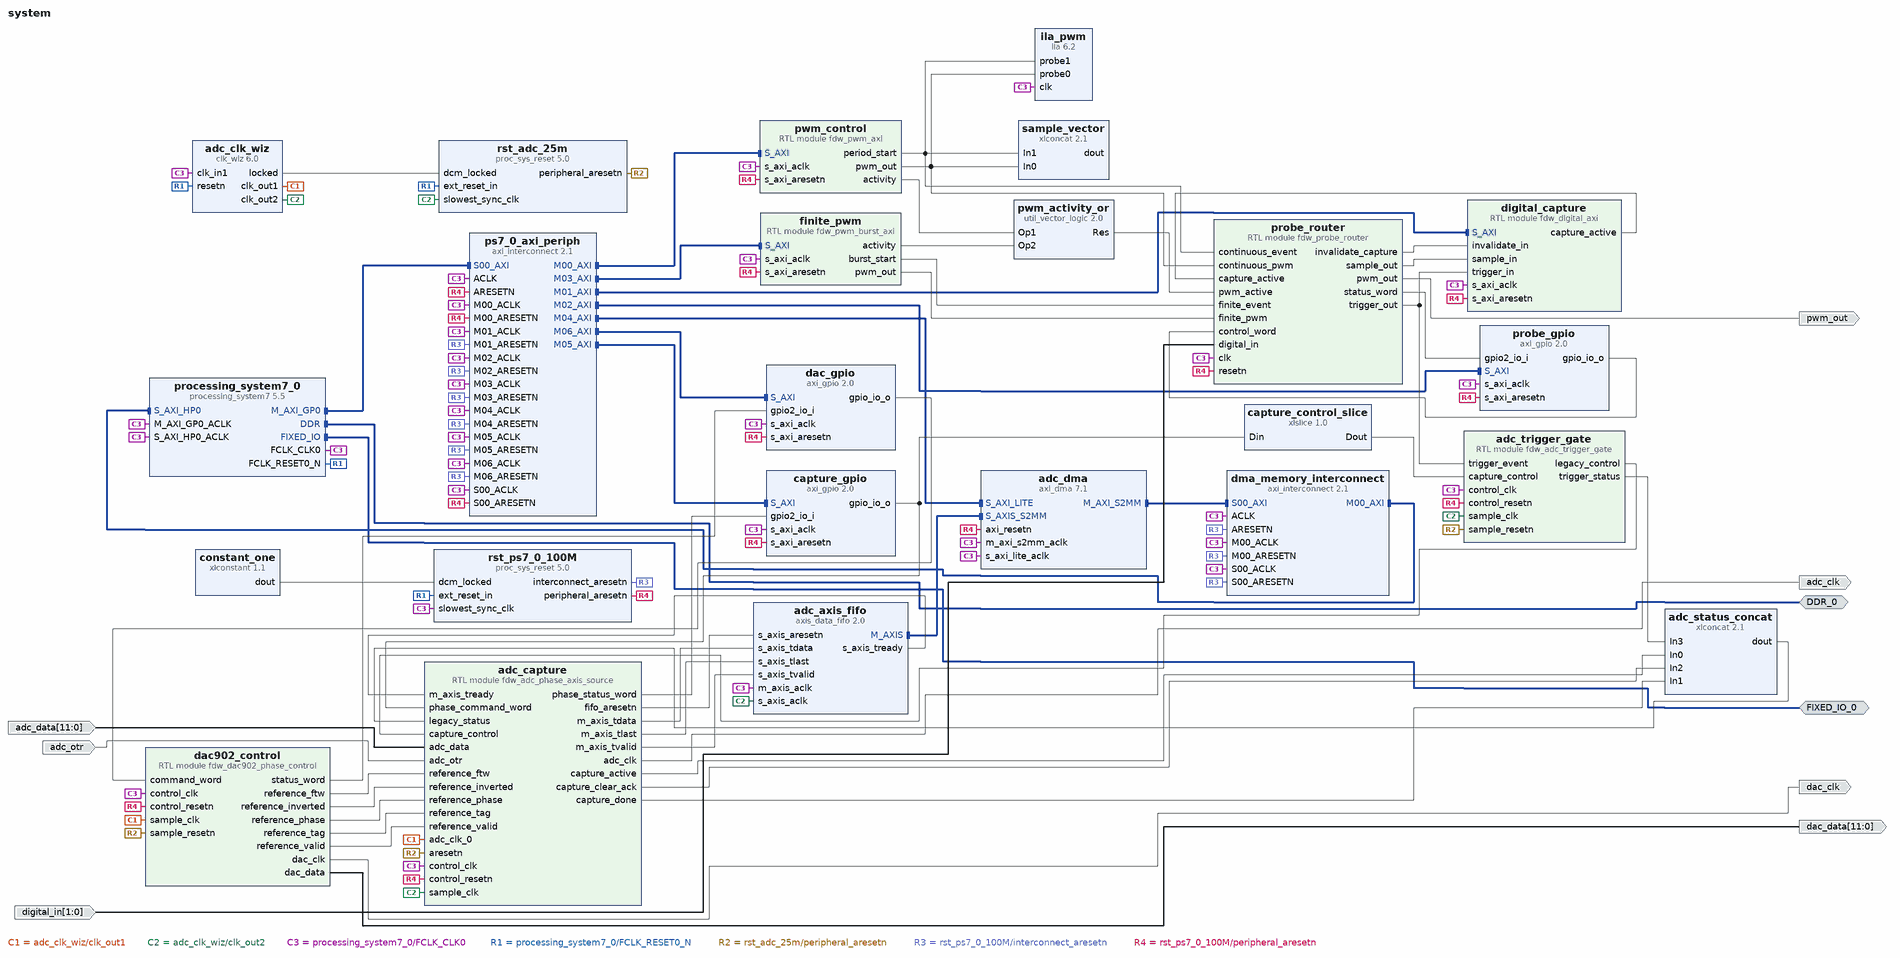
[diagram p0: block diagram of the top level]
# Vivado block design system, xc7z020clg484-2, Vivado 2025.1
create_bd_design system

create_bd_intf_port -mode Master -vlnv xilinx.com:interface:ddrx_rtl:1.0 DDR_0
create_bd_intf_port -mode Master -vlnv xilinx.com:display_processing_system7:fixedio_rtl:1.0 FIXED_IO_0
create_bd_port -dir I -from 1 -to 0 digital_in
create_bd_port -dir O pwm_out
create_bd_port -dir I -from 11 -to 0 adc_data
create_bd_port -dir I adc_otr
create_bd_port -dir O -type clk adc_clk
create_bd_port -dir O -from 11 -to 0 dac_data
create_bd_port -dir O dac_clk

create_bd_cell -type ip -vlnv xilinx.com:ip:processing_system7:5.5 processing_system7_0
set_property -dict [list \
  CONFIG.PCW_ENET0_ENET0_IO {MIO 16 .. 27} \
  CONFIG.PCW_ENET0_GRP_MDIO_ENABLE 1 \
  CONFIG.PCW_ENET0_GRP_MDIO_IO {MIO 52 .. 53} \
  CONFIG.PCW_ENET0_PERIPHERAL_ENABLE 1 \
  CONFIG.PCW_FCLK_CLK0_BUF FALSE \
  CONFIG.PCW_FPGA0_PERIPHERAL_FREQMHZ 100.000000 \
  CONFIG.PCW_PRESET_BANK1_VOLTAGE {LVCMOS 1.8V} \
  CONFIG.PCW_QSPI_GRP_SINGLE_SS_ENABLE 1 \
  CONFIG.PCW_QSPI_GRP_SINGLE_SS_IO {MIO 1 .. 6} \
  CONFIG.PCW_QSPI_PERIPHERAL_ENABLE 1 \
  CONFIG.PCW_QSPI_QSPI_IO {MIO 1 .. 6} \
  CONFIG.PCW_SD0_GRP_CD_ENABLE 1 \
  CONFIG.PCW_SD0_GRP_CD_IO {MIO 10} \
  CONFIG.PCW_SD0_GRP_WP_ENABLE 0 \
  CONFIG.PCW_SD0_PERIPHERAL_ENABLE 1 \
  CONFIG.PCW_SD0_SD0_IO {MIO 40 .. 45} \
  CONFIG.PCW_SDIO_PERIPHERAL_FREQMHZ 100 \
  CONFIG.PCW_SINGLE_QSPI_DATA_MODE x4 \
  CONFIG.PCW_UART0_PERIPHERAL_ENABLE 1 \
  CONFIG.PCW_UART0_UART0_IO {MIO 14 .. 15} \
  CONFIG.PCW_UART_PERIPHERAL_FREQMHZ 100 \
  CONFIG.PCW_UIPARAM_DDR_MEMORY_TYPE {DDR 3 (Low Voltage)} \
  CONFIG.PCW_UIPARAM_DDR_PARTNO {MT41K256M16 RE-125} \
  CONFIG.PCW_USE_S_AXI_HP0 1 \
] [get_bd_cells processing_system7_0]
# 136 more settings of processing_system7_0 are not shown: defaults, MIO pin electricals, DDR timing, and values the tool derives
create_bd_cell -type module -reference fdw_pwm_axi pwm_control
create_bd_cell -type ip -vlnv xilinx.com:ip:proc_sys_reset:5.0 rst_ps7_0_100M
create_bd_cell -type ip -vlnv xilinx.com:ip:xlconstant:1.1 constant_one
set_property -dict {CONFIG.CONST_VAL 1} [get_bd_cells constant_one]
create_bd_cell -type ip -vlnv xilinx.com:ip:axi_interconnect:2.1 ps7_0_axi_periph
set_property -dict {CONFIG.NUM_MI 7} [get_bd_cells ps7_0_axi_periph]
create_bd_cell -type ip -vlnv xilinx.com:ip:ila:6.2 ila_pwm
set_property -dict [list \
  CONFIG.C_DATA_DEPTH 1024 \
  CONFIG.C_MONITOR_TYPE Native \
  CONFIG.C_NUM_OF_PROBES 2 \
  CONFIG.C_PROBE0_WIDTH 1 \
  CONFIG.C_PROBE1_WIDTH 1 \
] [get_bd_cells ila_pwm]
create_bd_cell -type module -reference fdw_digital_axi digital_capture
set_property -dict {CONFIG.MAX_SAMPLES 1024 CONFIG.SAMPLE_WIDTH 2} [get_bd_cells digital_capture]
create_bd_cell -type ip -vlnv xilinx.com:ip:xlconcat:2.1 sample_vector
set_property -dict {CONFIG.NUM_PORTS 2} [get_bd_cells sample_vector]
create_bd_cell -type module -reference fdw_probe_router probe_router
create_bd_cell -type module -reference fdw_pwm_burst_axi finite_pwm
create_bd_cell -type ip -vlnv xilinx.com:ip:axi_gpio:2.0 probe_gpio
set_property -dict [list \
  CONFIG.C_ALL_INPUTS_2 1 \
  CONFIG.C_ALL_OUTPUTS 1 \
  CONFIG.C_DOUT_DEFAULT 0x00000000 \
  CONFIG.C_GPIO2_WIDTH 32 \
  CONFIG.C_GPIO_WIDTH 32 \
  CONFIG.C_IS_DUAL 1 \
] [get_bd_cells probe_gpio]
create_bd_cell -type ip -vlnv xilinx.com:ip:util_vector_logic:2.0 pwm_activity_or
set_property -dict {CONFIG.C_OPERATION or CONFIG.C_SIZE 1} [get_bd_cells pwm_activity_or]
create_bd_cell -type ip -vlnv xilinx.com:ip:clk_wiz:6.0 adc_clk_wiz
set_property -dict [list \
  CONFIG.CLKOUT1_REQUESTED_OUT_FREQ 25.000 \
  CONFIG.CLKOUT2_REQUESTED_OUT_FREQ 25.000 \
  CONFIG.CLKOUT2_REQUESTED_PHASE 180.000 \
  CONFIG.CLKOUT2_USED true \
  CONFIG.PRIM_IN_FREQ 100.000 \
  CONFIG.RESET_TYPE ACTIVE_LOW \
] [get_bd_cells adc_clk_wiz]
create_bd_cell -type ip -vlnv xilinx.com:ip:proc_sys_reset:5.0 rst_adc_25m
create_bd_cell -type ip -vlnv xilinx.com:ip:axis_data_fifo:2.0 adc_axis_fifo
set_property -dict [list \
  CONFIG.FIFO_DEPTH 16384 \
  CONFIG.HAS_TLAST 1 \
  CONFIG.IS_ACLK_ASYNC 1 \
  CONFIG.TDATA_NUM_BYTES 2 \
] [get_bd_cells adc_axis_fifo]
create_bd_cell -type ip -vlnv xilinx.com:ip:axi_dma:7.1 adc_dma
set_property -dict [list \
  CONFIG.c_include_mm2s 0 \
  CONFIG.c_include_s2mm 1 \
  CONFIG.c_include_sg 0 \
  CONFIG.c_m_axi_s2mm_data_width 32 \
  CONFIG.c_s2mm_burst_size 16 \
  CONFIG.c_s_axis_s2mm_tdata_width 16 \
  CONFIG.c_sg_length_width 23 \
] [get_bd_cells adc_dma]
create_bd_cell -type ip -vlnv xilinx.com:ip:axi_gpio:2.0 capture_gpio
set_property -dict [list \
  CONFIG.C_ALL_INPUTS_2 1 \
  CONFIG.C_ALL_OUTPUTS 1 \
  CONFIG.C_DOUT_DEFAULT 0x00000000 \
  CONFIG.C_GPIO2_WIDTH 32 \
  CONFIG.C_GPIO_WIDTH 32 \
  CONFIG.C_IS_DUAL 1 \
] [get_bd_cells capture_gpio]
create_bd_cell -type ip -vlnv xilinx.com:ip:axi_interconnect:2.1 dma_memory_interconnect
set_property -dict {CONFIG.NUM_MI 1 CONFIG.NUM_SI 1} [get_bd_cells dma_memory_interconnect]
create_bd_cell -type ip -vlnv xilinx.com:ip:xlconcat:2.1 adc_status_concat
set_property -dict {CONFIG.IN3_WIDTH 4 CONFIG.NUM_PORTS 4} [get_bd_cells adc_status_concat]
create_bd_cell -type module -reference fdw_adc_trigger_gate adc_trigger_gate
create_bd_cell -type ip -vlnv xilinx.com:ip:axi_gpio:2.0 dac_gpio
set_property -dict [list \
  CONFIG.C_ALL_INPUTS_2 1 \
  CONFIG.C_ALL_OUTPUTS 1 \
  CONFIG.C_DOUT_DEFAULT 0x00000000 \
  CONFIG.C_GPIO2_WIDTH 32 \
  CONFIG.C_GPIO_WIDTH 32 \
  CONFIG.C_IS_DUAL 1 \
] [get_bd_cells dac_gpio]
create_bd_cell -type module -reference fdw_adc_phase_axis_source adc_capture
set_property -dict {CONFIG.FRAME_SAMPLES 8192} [get_bd_cells adc_capture]
create_bd_cell -type module -reference fdw_dac902_phase_control dac902_control
set_property -dict [list \
  CONFIG.ROM_FILE C:/Users/33525/FDW_NEXT/outputs/r4b99_a4/sources/rtl/fdw_sine12_4096.mem \
] [get_bd_cells dac902_control]
create_bd_cell -type ip -vlnv xilinx.com:ip:xlslice:1.0 capture_control_slice
set_property -dict [list \
  CONFIG.DIN_FROM 2 \
  CONFIG.DIN_TO 0 \
  CONFIG.DIN_WIDTH 32 \
  CONFIG.DOUT_WIDTH 3 \
] [get_bd_cells capture_control_slice]

# ---- connections ----

connect_bd_intf_net [get_bd_intf_pins adc_axis_fifo/M_AXIS] [get_bd_intf_pins adc_dma/S_AXIS_S2MM]
connect_bd_intf_net [get_bd_intf_pins adc_dma/M_AXI_S2MM] [get_bd_intf_pins dma_memory_interconnect/S00_AXI]
connect_bd_intf_net [get_bd_intf_pins dma_memory_interconnect/M00_AXI] [get_bd_intf_pins processing_system7_0/S_AXI_HP0]
connect_bd_intf_net [get_bd_intf_ports DDR_0] [get_bd_intf_pins processing_system7_0/DDR]
connect_bd_intf_net [get_bd_intf_ports FIXED_IO_0] [get_bd_intf_pins processing_system7_0/FIXED_IO]
connect_bd_intf_net [get_bd_intf_pins processing_system7_0/M_AXI_GP0] [get_bd_intf_pins ps7_0_axi_periph/S00_AXI]
connect_bd_intf_net [get_bd_intf_pins ps7_0_axi_periph/M00_AXI] [get_bd_intf_pins pwm_control/S_AXI]
connect_bd_intf_net [get_bd_intf_pins ps7_0_axi_periph/M01_AXI] [get_bd_intf_pins digital_capture/S_AXI]
connect_bd_intf_net [get_bd_intf_pins ps7_0_axi_periph/M02_AXI] [get_bd_intf_pins probe_gpio/S_AXI]
connect_bd_intf_net [get_bd_intf_pins ps7_0_axi_periph/M03_AXI] [get_bd_intf_pins finite_pwm/S_AXI]
connect_bd_intf_net [get_bd_intf_pins ps7_0_axi_periph/M04_AXI] [get_bd_intf_pins adc_dma/S_AXI_LITE]
connect_bd_intf_net [get_bd_intf_pins ps7_0_axi_periph/M05_AXI] [get_bd_intf_pins capture_gpio/S_AXI]
connect_bd_intf_net [get_bd_intf_pins ps7_0_axi_periph/M06_AXI] [get_bd_intf_pins dac_gpio/S_AXI]
connect_bd_net [get_bd_pins adc_axis_fifo/s_axis_tready] [get_bd_pins adc_capture/m_axis_tready]
connect_bd_net [get_bd_pins adc_capture/adc_clk] [get_bd_ports adc_clk]
connect_bd_net [get_bd_pins adc_capture/capture_active] [get_bd_pins adc_status_concat/In0]
connect_bd_net [get_bd_pins adc_capture/capture_clear_ack] [get_bd_pins adc_status_concat/In2]
connect_bd_net [get_bd_pins adc_capture/capture_done] [get_bd_pins adc_status_concat/In1]
connect_bd_net [get_bd_pins adc_capture/fifo_aresetn] [get_bd_pins adc_axis_fifo/s_axis_aresetn]
connect_bd_net [get_bd_pins adc_capture/m_axis_tdata] [get_bd_pins adc_axis_fifo/s_axis_tdata]
connect_bd_net [get_bd_pins adc_capture/m_axis_tlast] [get_bd_pins adc_axis_fifo/s_axis_tlast]
connect_bd_net [get_bd_pins adc_capture/m_axis_tvalid] [get_bd_pins adc_axis_fifo/s_axis_tvalid]
connect_bd_net [get_bd_pins adc_capture/phase_status_word] [get_bd_pins capture_gpio/gpio2_io_i]
connect_bd_net [get_bd_pins adc_clk_wiz/clk_out1] [get_bd_pins adc_capture/adc_clk_0] [get_bd_pins dac902_control/sample_clk]
connect_bd_net [get_bd_pins adc_clk_wiz/clk_out2] \
  [get_bd_pins adc_axis_fifo/s_axis_aclk] [get_bd_pins rst_adc_25m/slowest_sync_clk] \
  [get_bd_pins adc_trigger_gate/sample_clk] [get_bd_pins adc_capture/sample_clk]
connect_bd_net [get_bd_pins adc_clk_wiz/locked] [get_bd_pins rst_adc_25m/dcm_locked]
connect_bd_net [get_bd_ports adc_data] [get_bd_pins adc_capture/adc_data]
connect_bd_net [get_bd_ports adc_otr] [get_bd_pins adc_capture/adc_otr]
connect_bd_net [get_bd_pins adc_status_concat/dout] [get_bd_pins adc_capture/legacy_status]
connect_bd_net [get_bd_pins adc_trigger_gate/legacy_control] [get_bd_pins adc_capture/capture_control]
connect_bd_net [get_bd_pins adc_trigger_gate/trigger_status] [get_bd_pins adc_status_concat/In3]
connect_bd_net [get_bd_pins capture_control_slice/Dout] [get_bd_pins adc_trigger_gate/capture_control]
connect_bd_net [get_bd_pins capture_gpio/gpio_io_o] [get_bd_pins capture_control_slice/Din] [get_bd_pins adc_capture/phase_command_word]
connect_bd_net [get_bd_pins constant_one/dout] [get_bd_pins rst_ps7_0_100M/dcm_locked]
connect_bd_net [get_bd_pins dac902_control/dac_clk] [get_bd_ports dac_clk]
connect_bd_net [get_bd_pins dac902_control/dac_data] [get_bd_ports dac_data]
connect_bd_net [get_bd_pins dac902_control/reference_ftw] [get_bd_pins adc_capture/reference_ftw]
connect_bd_net [get_bd_pins dac902_control/reference_inverted] [get_bd_pins adc_capture/reference_inverted]
connect_bd_net [get_bd_pins dac902_control/reference_phase] [get_bd_pins adc_capture/reference_phase]
connect_bd_net [get_bd_pins dac902_control/reference_tag] [get_bd_pins adc_capture/reference_tag]
connect_bd_net [get_bd_pins dac902_control/reference_valid] [get_bd_pins adc_capture/reference_valid]
connect_bd_net [get_bd_pins dac902_control/status_word] [get_bd_pins dac_gpio/gpio2_io_i]
connect_bd_net [get_bd_pins dac_gpio/gpio_io_o] [get_bd_pins dac902_control/command_word]
connect_bd_net [get_bd_pins digital_capture/capture_active] [get_bd_pins probe_router/capture_active]
connect_bd_net [get_bd_ports digital_in] [get_bd_pins probe_router/digital_in]
connect_bd_net [get_bd_pins finite_pwm/activity] [get_bd_pins pwm_activity_or/Op2]
connect_bd_net [get_bd_pins finite_pwm/burst_start] [get_bd_pins probe_router/finite_event]
connect_bd_net [get_bd_pins finite_pwm/pwm_out] [get_bd_pins probe_router/finite_pwm]
connect_bd_net [get_bd_pins probe_gpio/gpio_io_o] [get_bd_pins probe_router/control_word]
connect_bd_net [get_bd_pins probe_router/invalidate_capture] [get_bd_pins digital_capture/invalidate_in]
connect_bd_net [get_bd_pins probe_router/pwm_out] [get_bd_ports pwm_out]
connect_bd_net [get_bd_pins probe_router/sample_out] [get_bd_pins digital_capture/sample_in]
connect_bd_net [get_bd_pins probe_router/status_word] [get_bd_pins probe_gpio/gpio2_io_i]
connect_bd_net [get_bd_pins probe_router/trigger_out] [get_bd_pins adc_trigger_gate/trigger_event] [get_bd_pins digital_capture/trigger_in]
connect_bd_net [get_bd_pins processing_system7_0/FCLK_CLK0] \
  [get_bd_pins processing_system7_0/M_AXI_GP0_ACLK] [get_bd_pins rst_ps7_0_100M/slowest_sync_clk] \
  [get_bd_pins ps7_0_axi_periph/S00_ACLK] [get_bd_pins ps7_0_axi_periph/M00_ACLK] [get_bd_pins ps7_0_axi_periph/ACLK] \
  [get_bd_pins ila_pwm/clk] [get_bd_pins ps7_0_axi_periph/M01_ACLK] [get_bd_pins probe_gpio/s_axi_aclk] \
  [get_bd_pins ps7_0_axi_periph/M02_ACLK] [get_bd_pins ps7_0_axi_periph/M03_ACLK] [get_bd_pins pwm_control/s_axi_aclk] \
  [get_bd_pins probe_router/clk] [get_bd_pins finite_pwm/s_axi_aclk] [get_bd_pins processing_system7_0/S_AXI_HP0_ACLK] \
  [get_bd_pins adc_clk_wiz/clk_in1] [get_bd_pins adc_dma/s_axi_lite_aclk] [get_bd_pins adc_dma/m_axi_s2mm_aclk] \
  [get_bd_pins capture_gpio/s_axi_aclk] [get_bd_pins ps7_0_axi_periph/M04_ACLK] [get_bd_pins ps7_0_axi_periph/M05_ACLK] \
  [get_bd_pins dma_memory_interconnect/ACLK] [get_bd_pins dma_memory_interconnect/S00_ACLK] \
  [get_bd_pins dma_memory_interconnect/M00_ACLK] [get_bd_pins adc_axis_fifo/m_axis_aclk] \
  [get_bd_pins adc_trigger_gate/control_clk] [get_bd_pins dac_gpio/s_axi_aclk] [get_bd_pins ps7_0_axi_periph/M06_ACLK] \
  [get_bd_pins digital_capture/s_axi_aclk] [get_bd_pins dac902_control/control_clk] [get_bd_pins adc_capture/control_clk]
connect_bd_net [get_bd_pins processing_system7_0/FCLK_RESET0_N] \
  [get_bd_pins rst_ps7_0_100M/ext_reset_in] [get_bd_pins adc_clk_wiz/resetn] [get_bd_pins rst_adc_25m/ext_reset_in]
connect_bd_net [get_bd_pins pwm_activity_or/Res] [get_bd_pins probe_router/pwm_active]
connect_bd_net [get_bd_pins pwm_control/activity] [get_bd_pins pwm_activity_or/Op1]
connect_bd_net [get_bd_pins pwm_control/period_start] \
  [get_bd_pins ila_pwm/probe1] [get_bd_pins sample_vector/In1] [get_bd_pins probe_router/continuous_event]
connect_bd_net [get_bd_pins pwm_control/pwm_out] \
  [get_bd_pins ila_pwm/probe0] [get_bd_pins sample_vector/In0] [get_bd_pins probe_router/continuous_pwm]
connect_bd_net [get_bd_pins rst_adc_25m/peripheral_aresetn] \
  [get_bd_pins adc_trigger_gate/sample_resetn] [get_bd_pins adc_capture/aresetn] [get_bd_pins dac902_control/sample_resetn]
connect_bd_net [get_bd_pins rst_ps7_0_100M/interconnect_aresetn] \
  [get_bd_pins ps7_0_axi_periph/M01_ARESETN] [get_bd_pins ps7_0_axi_periph/M02_ARESETN] \
  [get_bd_pins ps7_0_axi_periph/M03_ARESETN] [get_bd_pins ps7_0_axi_periph/M04_ARESETN] \
  [get_bd_pins ps7_0_axi_periph/M05_ARESETN] [get_bd_pins dma_memory_interconnect/ARESETN] \
  [get_bd_pins dma_memory_interconnect/S00_ARESETN] [get_bd_pins dma_memory_interconnect/M00_ARESETN] \
  [get_bd_pins ps7_0_axi_periph/M06_ARESETN]
connect_bd_net [get_bd_pins rst_ps7_0_100M/peripheral_aresetn] \
  [get_bd_pins ps7_0_axi_periph/S00_ARESETN] [get_bd_pins ps7_0_axi_periph/M00_ARESETN] \
  [get_bd_pins ps7_0_axi_periph/ARESETN] [get_bd_pins probe_gpio/s_axi_aresetn] [get_bd_pins pwm_control/s_axi_aresetn] \
  [get_bd_pins probe_router/resetn] [get_bd_pins finite_pwm/s_axi_aresetn] [get_bd_pins adc_dma/axi_resetn] \
  [get_bd_pins capture_gpio/s_axi_aresetn] [get_bd_pins adc_trigger_gate/control_resetn] [get_bd_pins dac_gpio/s_axi_aresetn] \
  [get_bd_pins digital_capture/s_axi_aresetn] [get_bd_pins dac902_control/control_resetn] \
  [get_bd_pins adc_capture/control_resetn]
# net sample_vector_dout has one end: sample_vector/dout

# ---- address map ----
assign_bd_address -offset 0x00000000 -range 512M -target_address_space [get_bd_addr_spaces adc_dma/Data_S2MM] [get_bd_addr_segs processing_system7_0/S_AXI_HP0/HP0_DDR_LOWOCM]
assign_bd_address -offset 0x40400000 -range 64K -target_address_space [get_bd_addr_spaces processing_system7_0/Data] [get_bd_addr_segs adc_dma/S_AXI_LITE/Reg]
assign_bd_address -offset 0x41200000 -range 64K -target_address_space [get_bd_addr_spaces processing_system7_0/Data] [get_bd_addr_segs capture_gpio/S_AXI/Reg]
assign_bd_address -offset 0x41210000 -range 64K -target_address_space [get_bd_addr_spaces processing_system7_0/Data] [get_bd_addr_segs dac_gpio/S_AXI/Reg]
assign_bd_address -offset 0x43C00000 -range 4K -target_address_space [get_bd_addr_spaces processing_system7_0/Data] [get_bd_addr_segs pwm_control/S_AXI/reg0]
assign_bd_address -offset 0x43C10000 -range 4K -target_address_space [get_bd_addr_spaces processing_system7_0/Data] [get_bd_addr_segs digital_capture/S_AXI/reg0]
assign_bd_address -offset 0x43C20000 -range 4K -target_address_space [get_bd_addr_spaces processing_system7_0/Data] [get_bd_addr_segs probe_gpio/S_AXI/Reg]
assign_bd_address -offset 0x43C30000 -range 4K -target_address_space [get_bd_addr_spaces processing_system7_0/Data] [get_bd_addr_segs finite_pwm/S_AXI/reg0]

validate_bd_design
save_bd_design
